# Altium project NewTrackerMain.PrjPcb (part 6 of 6)

## Sheet StepperPower.SchDoc
size A4; SheetNumber: 2; SheetTotal: 6
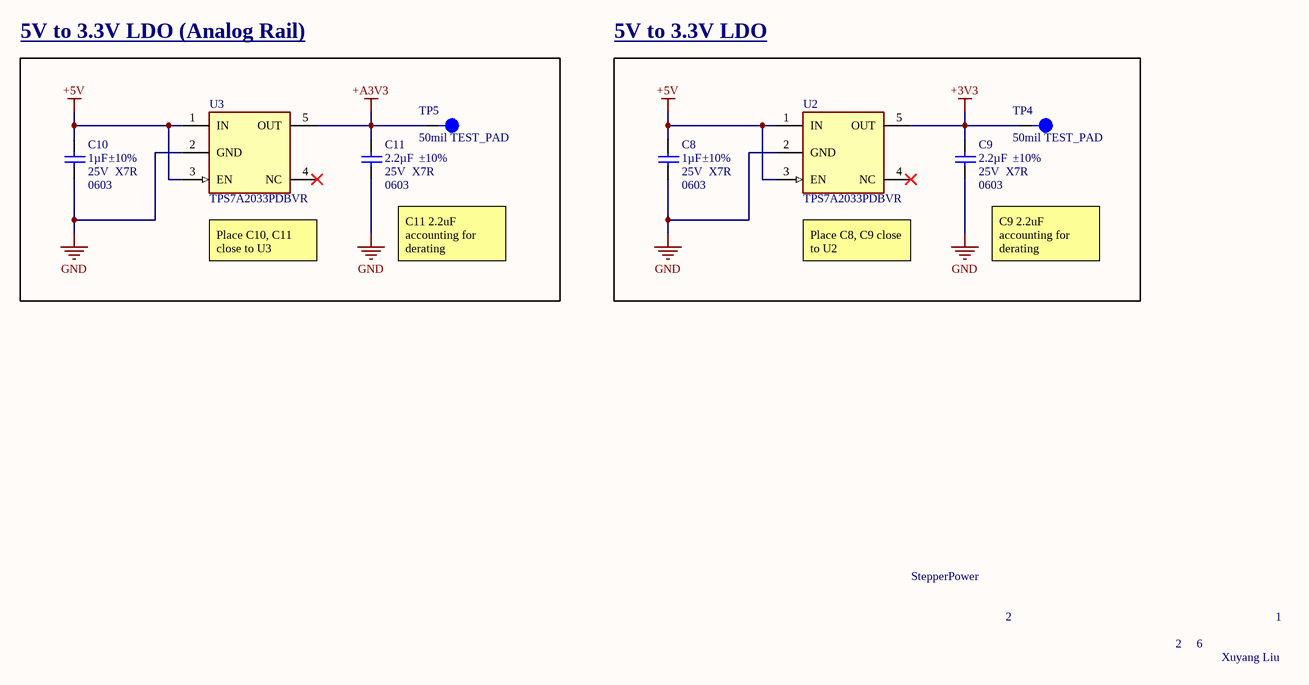
[diagram p5: StepperPower.SchDoc]

### Parts
C8  Voltage: 25V  Tolerance: ±10%  Dielectric: X7R  Case/Package: 0603  Capacitance: 1µF  [0603_CAP]  (hidden comment: 1uF)
C9  2.2µF  Dielectric Material: X7R  Voltage Rating: 25V  Tolerance: ±10%  Case/Package: 0603  [0603_CAP]
C10  Voltage: 25V  Tolerance: ±10%  Dielectric: X7R  Case/Package: 0603  Capacitance: 1µF  [0603_CAP]  (hidden comment: 1uF)
C11  2.2µF  Dielectric Material: X7R  Voltage Rating: 25V  Tolerance: ±10%  Case/Package: 0603  [0603_CAP]
TP4  50mil TEST_PAD  [15mil_TEST_PAD]
TP5  50mil TEST_PAD  [15mil_TEST_PAD]
U2  TPS7A2033PDBVR  [FP-DBV0005A-MFG]
U3  TPS7A2033PDBVR  [FP-DBV0005A-MFG]

### Blocks framed on the sheet
5V to 3.3V LDO (Analog Rail): C10 C11 TP5 U3
5V to 3.3V LDO: C8 C9 TP4 U2

### Nets
+3V3: C9.2 TP4.1 U2.5(OUT)
+5V: C8.2 C10.2 U2.1(IN) U2.3(EN) U3.1(IN) U3.3(EN)
+A3V3: C11.2 TP5.1 U3.5(OUT)
GND: C8.1 C9.1 C10.1 C11.1 U2.2(GND) U3.2(GND)

Not connected (* = marked no-connect by the designer): U2 4(NC)*; U3 4(NC)*

### Notes on the sheet
- (near U3) Place C10, C11 close to U3
- (near C11) C11 2.2uF accounting for derating
- (near U2) Place C8, C9 close to U2
- (near C9) C9 2.2uF accounting for derating
- StepperPower
- 2
- 2     6
- 1
- Xuyang Liu
- (in symbol 865080645012) +

### Library data of the parts
C8 C10 = GCM188R71E105KA64D: 25V 1uF X7R ±10% 0603 Multilayer Ceramic Capacitors MLCC - SMD/SMT ROHS; Manufacturer: Murata; Manufacturer Lifecycle Status: IN PRODUCTION; Supplier 1: DigiKey; Manufacturer Part Number: GCM188R71E105KA64D; RoHS: Compliant; Category: Ceramic Capacitors; Stock 1: 751115; Pricing 1: 1=0.19, 10=0.106, 50=0.0752, 100=0.0658, 500=0.04994, 1000=0.04504 (USD); Case Code (Imperial): 0603; Case Code (Metric): 1608; Country of Origin: Philippines; Depth: 800µm; Dielectric Material: Ceramic; Export Control Classification Number (ECCN) Code: EAR99; Height: 800µm; Harmonized Tariff Schedule (HTS) Code: 8532.24.00.20; Introduction Date: 2010-10-29; Lead Free: Lead Free; Length: 1.6mm; Lifecycle Status: Production; Material: Ceramic; Max Operating Temperature: 125°C; Min Operating Temperature: -55°C; Mount: Surface Mount; Number of Terminals: 2; Packaging: Cut Tape; Radiation Hardening: No; Ratings: AEC-Q200; REACH SVHC: Yes; Schedule B: 8532240020, 8532240020|8532240020, 8532240020|8532240020|8532240020, 8532240020|8532240020|8532240020|8532240020; Termination: SMD/SMT; Voltage Rating: 25V; Voltage Rating (DC): 25V; Weight: 6.293594mg; Width: 800µm; ComponentLink1URL: https://datasheet.octopart.com:443/GCM188R71E105KA64D-Murata-datasheet-39128443.pdf?src-supplier=Newark; ComponentLink1Description: https://datasheet.octopart.com:443/GCM188R71E105KA64D-Murata-datasheet-39128443.pdf?src-supplier=Newark; ComponentLink2URL: https://datasheet.octopart.com:443/GCM188R71E105KA64D-Murata-datasheet-62316951.pdf?src-supplier=element14+APAC; ComponentLink2Description: https://datasheet.octopart.com:443/GCM188R71E105KA64D-Murata-datasheet-62316951.pdf?src-supplier=element14+APAC; ComponentLink3URL: https://datasheet.octopart.com:443/GCM188R71E105KA64D-Murata-datasheet-141267554.pdf?src-supplier=Geoflip; ComponentLink3Description: https://datasheet.octopart.com:443/GCM188R71E105KA64D-Murata-datasheet-141267554.pdf?src-supplier=Geoflip; ComponentLink4URL: https://datasheet.octopart.com:443/GCM188R71E105KA64D-Murata-datasheet-140658666.pdf?src-supplier=Ciiva; ComponentLink4Description: https://datasheet.octopart.com:443/GCM188R71E105KA64D-Murata-datasheet-140658666.pdf?src-supplier=Ciiva; ComponentLink5URL: https://datasheet.octopart.com:443/GCM188R71E105KA64D-Murata-datasheet-138718232.pdf?src-supplier=Ciiva; ComponentLink5Description: https://datasheet.octopart.com:443/GCM188R71E105KA64D-Murata-datasheet-138718232.pdf?src-supplier=Ciiva; ComponentLink6URL: https://datasheet.octopart.com:443/GCM188R71E105KA64D-Murata-datasheet-81455541.pdf?src-supplier=TME; ComponentLink6Description: https://datasheet.octopart.com:443/GCM188R71E105KA64D-Murata-datasheet-81455541.pdf?src-supplier=TME; ComponentLink7URL: https://datasheet.octopart.com/GCM188R71E105KA64D-Murata-datasheet-14404430.pdf; ComponentLink7Description: https://datasheet.octopart.com/GCM188R71E105KA64D-Murata-datasheet-14404430.pdf; ComponentLink8URL: https://datasheet.octopart.com:443/GCM188R71E105KA64D-Murata-datasheet-14393380.pdf?src-supplier=Future+Electronics; ComponentLink8Description: https://datasheet.octopart.com:443/GCM188R71E105KA64D-Murata-datasheet-14393380.pdf?src-supplier=Future+Electronics; ComponentLink9URL: https://datasheet.octopart.com:443/GCM188R71E105KA64D-Murata-datasheet-44103482.pdf?src-supplier=Future+Electronics; ComponentLink9Description: https://datasheet.octopart.com:443/GCM188R71E105KA64D-Murata-datasheet-44103482.pdf?src-supplier=Future+Electronics; ComponentLink10URL: http://sigma.octopart.com:80/reach_statement/Murata-company-16.pdf?src-supplier=Compliance+Statements; ComponentLink10Description: http://sigma.octopart.com:80/reach_statement/Murata-company-16.pdf?src-supplier=Compliance+Statements; Supplier Part Number 1: 490-10673-1-ND
C9 C11 = GRM188Z71E225KE43D: 25V 2.2uF X7R ±10% 0603 Multilayer Ceramic Capacitors MLCC - SMD/SMT ROHS; Manufacturer: Murata; Manufacturer Lifecycle Status: IN PRODUCTION; Supplier 1: DigiKey; Manufacturer Part Number: GRM188Z71E225KE43D; RoHS: Compliant; Category: Ceramic Capacitors; Stock 1: 149124; Pricing 1: 1=0.17, 10=0.096, 50=0.068, 100=0.0593, 500=0.04474, 1000=0.04026 (USD); Export Control Classification Number (ECCN) Code: EAR99; Height: 800µm; Harmonized Tariff Schedule (HTS) Code: 8532.24.00.20; Introduction Date: 2017-02-21; Length: 1.6mm; Lifecycle Status: Production; Material: Ceramic; Max Operating Temperature: 125°C; Min Operating Temperature: -55°C; Mount: Surface Mount; Number of Terminals: 2; REACH SVHC: Yes; Thickness: 800µm; Voltage Rating (DC): 25V; Width: 800µm; ComponentLink1URL: https://datasheet.octopart.com:443/GRM188Z71E225KE43D-Murata-datasheet-141276026.pdf?src-supplier=Geoflip; ComponentLink1Description: https://datasheet.octopart.com:443/GRM188Z71E225KE43D-Murata-datasheet-141276026.pdf?src-supplier=Geoflip; ComponentLink2URL: https://datasheet.octopart.com:443/GRM188Z71E225KE43D-Murata-datasheet-165579666.pdf?src-supplier=TME; ComponentLink2Description: https://datasheet.octopart.com:443/GRM188Z71E225KE43D-Murata-datasheet-165579666.pdf?src-supplier=TME; ComponentLink3URL: https://datasheet.octopart.com:443/GRM188Z71E225KE43D-Murata-datasheet-140705919.pdf?src-supplier=Ciiva; ComponentLink3Description: https://datasheet.octopart.com:443/GRM188Z71E225KE43D-Murata-datasheet-140705919.pdf?src-supplier=Ciiva; ComponentLink4URL: https://datasheet.octopart.com:443/GRM188Z71E225KE43D-Murata-datasheet-138743437.pdf?src-supplier=Ciiva; ComponentLink4Description: https://datasheet.octopart.com:443/GRM188Z71E225KE43D-Murata-datasheet-138743437.pdf?src-supplier=Ciiva; ComponentLink5URL: http://sigma.octopart.com:80/reach_statement/Murata-company-16.pdf?src-supplier=Compliance+Statements; ComponentLink5Description: http://sigma.octopart.com:80/reach_statement/Murata-company-16.pdf?src-supplier=Compliance+Statements; Supplier Part Number 1: 490-GRM188Z71E225KE43DCT-ND; Capacitance: 2.2µF
U2 U3 = TPS7A2033PDBVR: 300mA ultra-low-noise low-IQ low-dropout (LDO) linear regulator with high PSRR 5-SOT-23 -40 to 125; Manufacturer: Texas Instruments; Manufacturer Lifecycle Status: ACTIVE; Accuracy: 1.5%; Dropout Voltage: 145mV; Max Junction Temperature (Tj): 125°C; Max Supply Voltage: 6V; Min Supply Voltage: 1.6V; Nominal Supply Current: 6.5µA; Number of Channels: 1; Output Voltage: 3.3V; Supplier 1: DigiKey; Manufacturer Part Number: TPS7A2033PDBVR; RoHS: Compliant; Category: LDO Voltage Regulators; Stock 1: 57995; Pricing 1: 1=0.33, 10=0.225, 25=0.1992, 100=0.1715, 250=0.15828, 500=0.15028, 1000=0.14369 (USD); Case/Package: SOT-23-5; Height: 1.45mm; Length: 2.9mm; Lifecycle Status: Production; Max Operating Temperature: 125°C; Min Operating Temperature: -40°C; Number of Outputs: 1; Number of Pins: 5; Output Current: 300mA; Thickness: 1.2mm; Width: 1.6mm; ComponentLink1URL: https://sigma.octopart.com:443/177332311/technical_drawing/Texas-Instruments-TPS7A2033PDBVR.pdf?src-supplier=Texas+Instruments; ComponentLink1Description: https://sigma.octopart.com:443/177332311/technical_drawing/Texas-Instruments-TPS7A2033PDBVR.pdf?src-supplier=Texas+Instruments; ComponentLink2URL: https://octopart.com:443/opatz8j6/c1?t=jI4MJxUHNHWPLUTUjPFE_I4nFT9ogQQS70wFg6iEODFO8LbYHvqBDKPBMlDtEwO4fNGI88ubVwCkCjf0m79oYyvw0lNgXSr_kQlB_nshs-lDL0gpQEt062WpfwVbrY7aMcaNfk_VYcVu1c5ZyMHT8tYLznoJcMs0V3cIKOpV8FkTUbmZxBhaArT7MSQXB5rB175PQ9HeqkODOBcAb5uxQ4pXmdIRVFW0nHjT5bbTxbLCkHYQ6wSbjOTmjpzrmMdRq376bhW5SzS0L0ZYTijf2l1mplZ7KrrI9CUmQvcyMNcVPe6befGlNnr1fDH3Q5Ss6aSm6FD-UpaqOnEuIpR4XaVo6xK0ksEziWk1rzqOuekfSo_fNioOtoDqTgyhaxobMR58zb0N&src-supplier=Texas+Instruments; ComponentLink2Description: https://octopart.com:443/opatz8j6/c1?t=jI4MJxUHNHWPLUTUjPFE_I4nFT9ogQQS70wFg6iEODFO8LbYHvqBDKPBMlDtEwO4fNGI88ubVwCkCjf0m79oYyvw0lNgXSr_kQlB_nshs-lDL0gpQEt062WpfwVbrY7aMcaNfk_VYcVu1c5ZyMHT8tYLznoJcMs0V3cIKOpV8FkTUbmZxBhaArT7MSQXB5rB175PQ9HeqkODOBcAb5uxQ4pXmdIRVFW0nHjT5bbTxbLCkHYQ6wSbjOTmjpzrmMdRq376bhW5SzS0L0ZYTijf2l1mplZ7KrrI9CUmQvcyMNcVPe6befGlNnr1fDH3Q5Ss6aSm6FD-UpaqOnEuIpR4XaVo6xK0ksEziWk1rzqOuekfSo_fNioOtoDqTgyhaxobMR58zb0N&src-supplier=Texas+Instruments; ComponentLink3URL: https://sigma.octopart.com:443/175570406/technical_drawing/Texas-Instruments-TPS7A2033PDBVR.pdf?src-supplier=Texas+Instruments; ComponentLink3Description: https://sigma.octopart.com:443/175570406/technical_drawing/Texas-Instruments-TPS7A2033PDBVR.pdf?src-supplier=Texas+Instruments; ComponentLink4URL: https://sigma.octopart.com:443/169406034/technical_drawing/Texas-Instruments-TPS7A2033PDBVR.pdf?src-supplier=Texas+Instruments; ComponentLink4Description: https://sigma.octopart.com:443/169406034/technical_drawing/Texas-Instruments-TPS7A2033PDBVR.pdf?src-supplier=Texas+Instruments; ComponentLink5URL: https://sigma.octopart.com:443/155939316/technical_drawing/Texas-Instruments-TPS7A2033PDBVR.pdf?src-supplier=Texas+Instruments; ComponentLink5Description: https://sigma.octopart.com:443/155939316/technical_drawing/Texas-Instruments-TPS7A2033PDBVR.pdf?src-supplier=Texas+Instruments; ComponentLink6URL: https://datasheet.octopart.com:443/TPS7A2033PDBVR-Texas-Instruments-datasheet-149070019.pdf?src-supplier=Upverter; ComponentLink6Description: https://datasheet.octopart.com:443/TPS7A2033PDBVR-Texas-Instruments-datasheet-149070019.pdf?src-supplier=Upverter; ComponentLink7URL: https://datasheet.octopart.com:443/TPS7A2033PDBVR-Texas-Instruments-datasheet-164420832.pdf?src-supplier=Augswan; ComponentLink7Description: https://datasheet.octopart.com:443/TPS7A2033PDBVR-Texas-Instruments-datasheet-164420832.pdf?src-supplier=Augswan; ComponentLink8URL: https://datasheet.octopart.com:443/TPS7A2033PDBVR-Texas-Instruments-datasheet-159781690.pdf?src-supplier=LCSC; ComponentLink8Description: https://datasheet.octopart.com:443/TPS7A2033PDBVR-Texas-Instruments-datasheet-159781690.pdf?src-supplier=LCSC; ComponentLink9URL: http://sigma.octopart.com:80/reach_statement/Texas-Instruments-company-64.pdf?src-supplier=Compliance+Statements; ComponentLink9Description: http://sigma.octopart.com:80/reach_statement/Texas-Instruments-company-64.pdf?src-supplier=Compliance+Statements; ComponentLink10URL: http://sigma.octopart.com:80/conflict_mineral_statement/Texas-Instruments-company-63.pdf?src-supplier=Compliance+Statements; ComponentLink10Description: http://sigma.octopart.com:80/conflict_mineral_statement/Texas-Instruments-company-63.pdf?src-supplier=Compliance+Statements; Supplier Part Number 1: 296-TPS7A2033PDBVRDKR-ND

## Nets that join several sheets
+3V3: MCU (13 pins), Motor1 (C4.2 U7.12), Motor2 (C2.2 U5.12), Peripherals (C29.2 R11.1), StepperPower (C9.2 TP4.1 U2.5)
+5V: Motor1 (CSR2.2 U6.3), Motor2 (CSR1.2 U4.3), Peripherals (Q1.S TP3.1), StepperPower (6 pins)
+A3V3: MCU (R20.1), Motor1 (C17.2 U6.5), Motor2 (C12.2 U4.5), StepperPower (C11.2 TP5.1 U3.5)
GND: MCU (20 pins), Motor1 (9 pins), Motor2 (9 pins), Peripherals (11 pins), StepperPower (6 pins)
MOT1_A1: Motor1 (U7.2), Peripherals (P4.1)
MOT1_A2: Motor1 (U7.3), Peripherals (P4.2)
MOT1_AIN1: MCU (U11.30), Motor1 (U7.10)
MOT1_AIN2: MCU (U11.31), Motor1 (U7.9)
MOT1_B1: Motor1 (U7.4), Peripherals (P4.7)
MOT1_B2: Motor1 (U7.5), Peripherals (P4.8)
MOT1_BIN1: MCU (U11.32), Motor1 (U7.8)
MOT1_BIN2: MCU (U11.33), Motor1 (U7.7)
MOT1_C_SENSE: MCU (U11.17), Motor1 (C18.2 R7.2)
MOT1_MODE: MCU (U11.34), Motor1 (U7.11)
MOT2_A1: Motor2 (U5.2), Peripherals (P4.3)
MOT2_A2: Motor2 (U5.3), Peripherals (P4.4)
MOT2_AIN1: MCU (U11.25), Motor2 (U5.10)
MOT2_AIN2: MCU (U11.26), Motor2 (U5.9)
MOT2_B1: Motor2 (U5.4), Peripherals (P4.5)
MOT2_B2: Motor2 (U5.5), Peripherals (P4.6)
MOT2_BIN1: MCU (U11.27), Motor2 (U5.8)
MOT2_BIN2: MCU (U11.28), Motor2 (U5.7)
MOT2_C_SENSE: MCU (U11.18), Motor2 (C13.2 R6.2)
MOT2_MODE: MCU (U11.29), Motor2 (U5.11)
NRST: MCU (5 pins), Peripherals (P2.5 U9.1 U9.10)
SPI1_MISO2: MCU (R16.1), Peripherals (P3.5 U10.2 U10.9)
SPI1_MOSI: MCU (U11.15), Peripherals (P3.6 U10.1 U10.10)
SPI1_NSS: MCU (R14.2 U11.12), Peripherals (P3.3 U10.5 U10.6)
SPI1_SCK: MCU (U11.13), Peripherals (P3.4 U10.4 U10.7)
SWCLK: MCU (U11.38), Peripherals (P2.4 U9.2 U9.9)
SWDIO: MCU (U11.37), Peripherals (P2.3 U9.4 U9.7)
UART_RX: MCU (U11.41), Peripherals (P1.3)
UART_TX: MCU (U11.40), Peripherals (P1.2)